# Altium project STAND POWER.PrjPcb
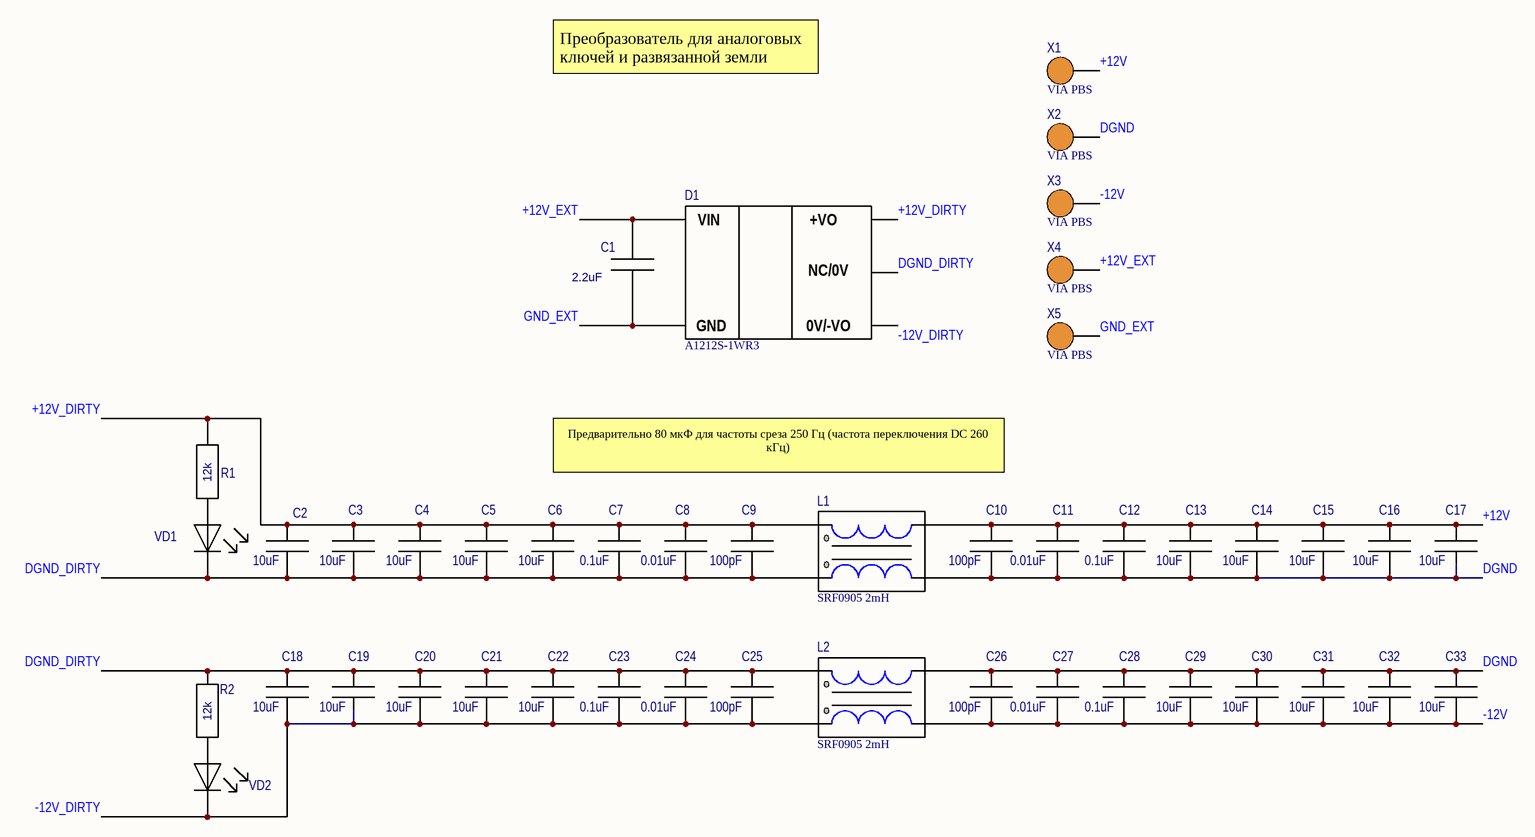
[diagram p0: POWER.SchDoc]
1 sheet, 45 parts. Net scope: global (net labels, ports and power ports of the same name join across sheets).
Board file: PCB1.PcbDoc

## Sheet POWER.SchDoc: ИЛ186СП2/1
size 410 x 297 mm; ApprovedBy: Кубатко В.А.; CheckedBy: Кубатко В.А.; Author: Сергеев Д.А.; CompanyName: ГК "СНАБЖЕНИЕ"; DrawnBy: Сергеев Д.А.; Engineer: Сергеев Д.А.; Organization: ГК "СНАБЖЕНИЕ"; DocumentNumber: ИЛ186СП2/1; Revision: 1; SheetNumber: 1; SheetTotal: 1; Sheet Name: POWER

### Parts
C1  2.2uF  [0603]
C2  value 10uF  [0603]  (hidden comment: 10uF 0603 25V)
C3  value 10uF  [0603]  (hidden comment: 10uF 0603 25V)
C4  value 10uF  [0603]  (hidden comment: 10uF 0603 25V)
C5  value 10uF  [0603]  (hidden comment: 10uF 0603 25V)
C6  value 10uF  [0603]  (hidden comment: 10uF 0603 25V)
C7  value 0.1uF  [0603]  (hidden comment: 0.1uF 0603 25V)
C8  value 0.01uF  [0603]  (hidden comment: 0.01uF 0603 25V)
C9  value 100pF  [0603]  (hidden comment: 100pF 0603 25V)
C10  value 100pF  [0603]  (hidden comment: 10uF 0603 25V)
C11  value 0.01uF  [0603]  (hidden comment: 10uF 0603 25V)
C12  value 0.1uF  [0603]  (hidden comment: 10uF 0603 25V)
C13  value 10uF  [0603]  (hidden comment: 10uF 0603 25V)
C14  value 10uF  [0603]  (hidden comment: 10uF 0603 25V)
C15  value 10uF  [0603]  (hidden comment: 0.1uF 0603 25V)
C16  value 10uF  [0603]  (hidden comment: 0.01uF 0603 25V)
C17  value 10uF  [0603]  (hidden comment: 100pF 0603 25V)
C18  value 10uF  [0603]  (hidden comment: 10uF 0603 25V)
C19  value 10uF  [0603]  (hidden comment: 10uF 0603 25V)
C20  value 10uF  [0603]  (hidden comment: 10uF 0603 25V)
C21  value 10uF  [0603]  (hidden comment: 10uF 0603 25V)
C22  value 10uF  [0603]  (hidden comment: 10uF 0603 25V)
C23  value 0.1uF  [0603]  (hidden comment: 0.1uF 0603 25V)
C24  value 0.01uF  [0603]  (hidden comment: 0.01uF 0603 25V)
C25  value 100pF  [0603]  (hidden comment: 100pF 0603 25V)
C26  value 100pF  [0603]  (hidden comment: 10uF 0603 25V)
C27  value 0.01uF  [0603]  (hidden comment: 10uF 0603 25V)
C28  value 0.1uF  [0603]  (hidden comment: 10uF 0603 25V)
C29  value 10uF  [0603]  (hidden comment: 10uF 0603 25V)
C30  value 10uF  [0603]  (hidden comment: 10uF 0603 25V)
C31  value 10uF  [0603]  (hidden comment: 0.1uF 0603 25V)
C32  value 10uF  [0603]  (hidden comment: 0.01uF 0603 25V)
C33  value 10uF  [0603]  (hidden comment: 100pF 0603 25V)
D1  A1212S-1WR3  [A_S-1WR3 & B_LS-1WR3]
L1  SRF0905 2mH  [SRF0905]
L2  SRF0905 2mH  [SRF0905]
R1  12k  [0805]
R2  12k  [0805]
VD1  LED(0805)  [0805(LED)]  (value not drawn)
VD2  LED(0805)  [0805(LED)]  (value not drawn)
X1  VIA PBS  [VIA]
X2  VIA PBS  [VIA]
X3  VIA PBS  [VIA]
X4  VIA PBS  [VIA]
X5  VIA PBS  [VIA]

### Nets
+12V: C10.1 C11.1 C12.1 C13.1 C14.1 C15.1 C16.1 C17.1 L1.3 X1.1
+12V_DIRTY: C2.1 C3.1 C4.1 C5.1 C6.1 C7.1 C8.1 C9.1 D1.6 L1.2 R1.2
+12V_EXT: C1.1 D1.1 X4.1
-12V: C26.2 C27.2 C28.2 C29.2 C30.2 C31.2 C32.2 C33.2 L2.4 X3.1
-12V_DIRTY: C18.2 C19.2 C20.2 C21.2 C22.2 C23.2 C24.2 C25.2 D1.4 L2.1 VD2.2(K)
DGND: C10.2 C11.2 C12.2 C13.2 C14.2 C15.2 C16.2 C17.2 C26.1 C27.1 C28.1 C29.1 C30.1 C31.1 C32.1 C33.1 L1.4 L2.3 X2.1
DGND_DIRTY: C2.2 C3.2 C4.2 C5.2 C6.2 C7.2 C8.2 C9.2 C18.1 C19.1 C20.1 C21.1 C22.1 C23.1 C24.1 C25.1 D1.5 L1.1 L2.2 R2.2 VD1.2(K)
GND_EXT: C1.2 D1.2 X5.1
NetR1_1: R1.1 VD1.1(A)
NetR2_1: R2.1 VD2.1(A)

### Notes on the sheet
- Преобразователь для аналоговых ключей и развязанной земли
- Предварительно 80 мкФ для частоты среза 250 Гц (частота переключения DC 260 кГц)
- Перв. примен.
- Справ. №
- Подп. и дата
- Инв. № дубл.
- Взам. инв. №
- Разраб.
- Изм.
- Лист
- № докум.
- Подп.
- Дата
- Литера
- Масса
- Масштаб
- Пров.
- Т.контр.
- Листов
- Инв. № подл.
- Н.контр.
- Утв.
- Форма 1 ГОСТ 2.104-2006
- Копировал
- Формат А3
- (in symbol A_S-1WR3 & B_LS-1WR3) VIN; +VO; NC/0V; GND; 0V/-VO

### Library data of the parts
C1-C33 = C0603: ComponentHeigt: 1.3; Firme: AVX; Leadform: SMD; KIND: Конденсатор; ClassName: *; Component Link: *; ComponentWeigt: *; Packaging: 0805; NN: *
  C1: Value: *
D1 = A_S-1WR3 & B_LS-1WR3
L1 L2 = SRF0905
R1 R2 = R0805 Yageo: ComponentHeigt: 0.6; Leadform: SMD; Firme: Yageo; Kind: Резистор; ComponentWeigt: *; Packaging: 0805; Value: *; ClassName: *; Component Link: *; NN: *
VD1 VD2 = LED(0805): ComponentHeigt: 0.75; Leadform: в отверстия; Firme: Kingbright; NN: 24003000; KIND: Светодиод L-1154GD Kingbright; Component Link: *; ClassName: *
X1-X5 = VIA